# Altium schematic sheet ngoc.SchDoc
size A1
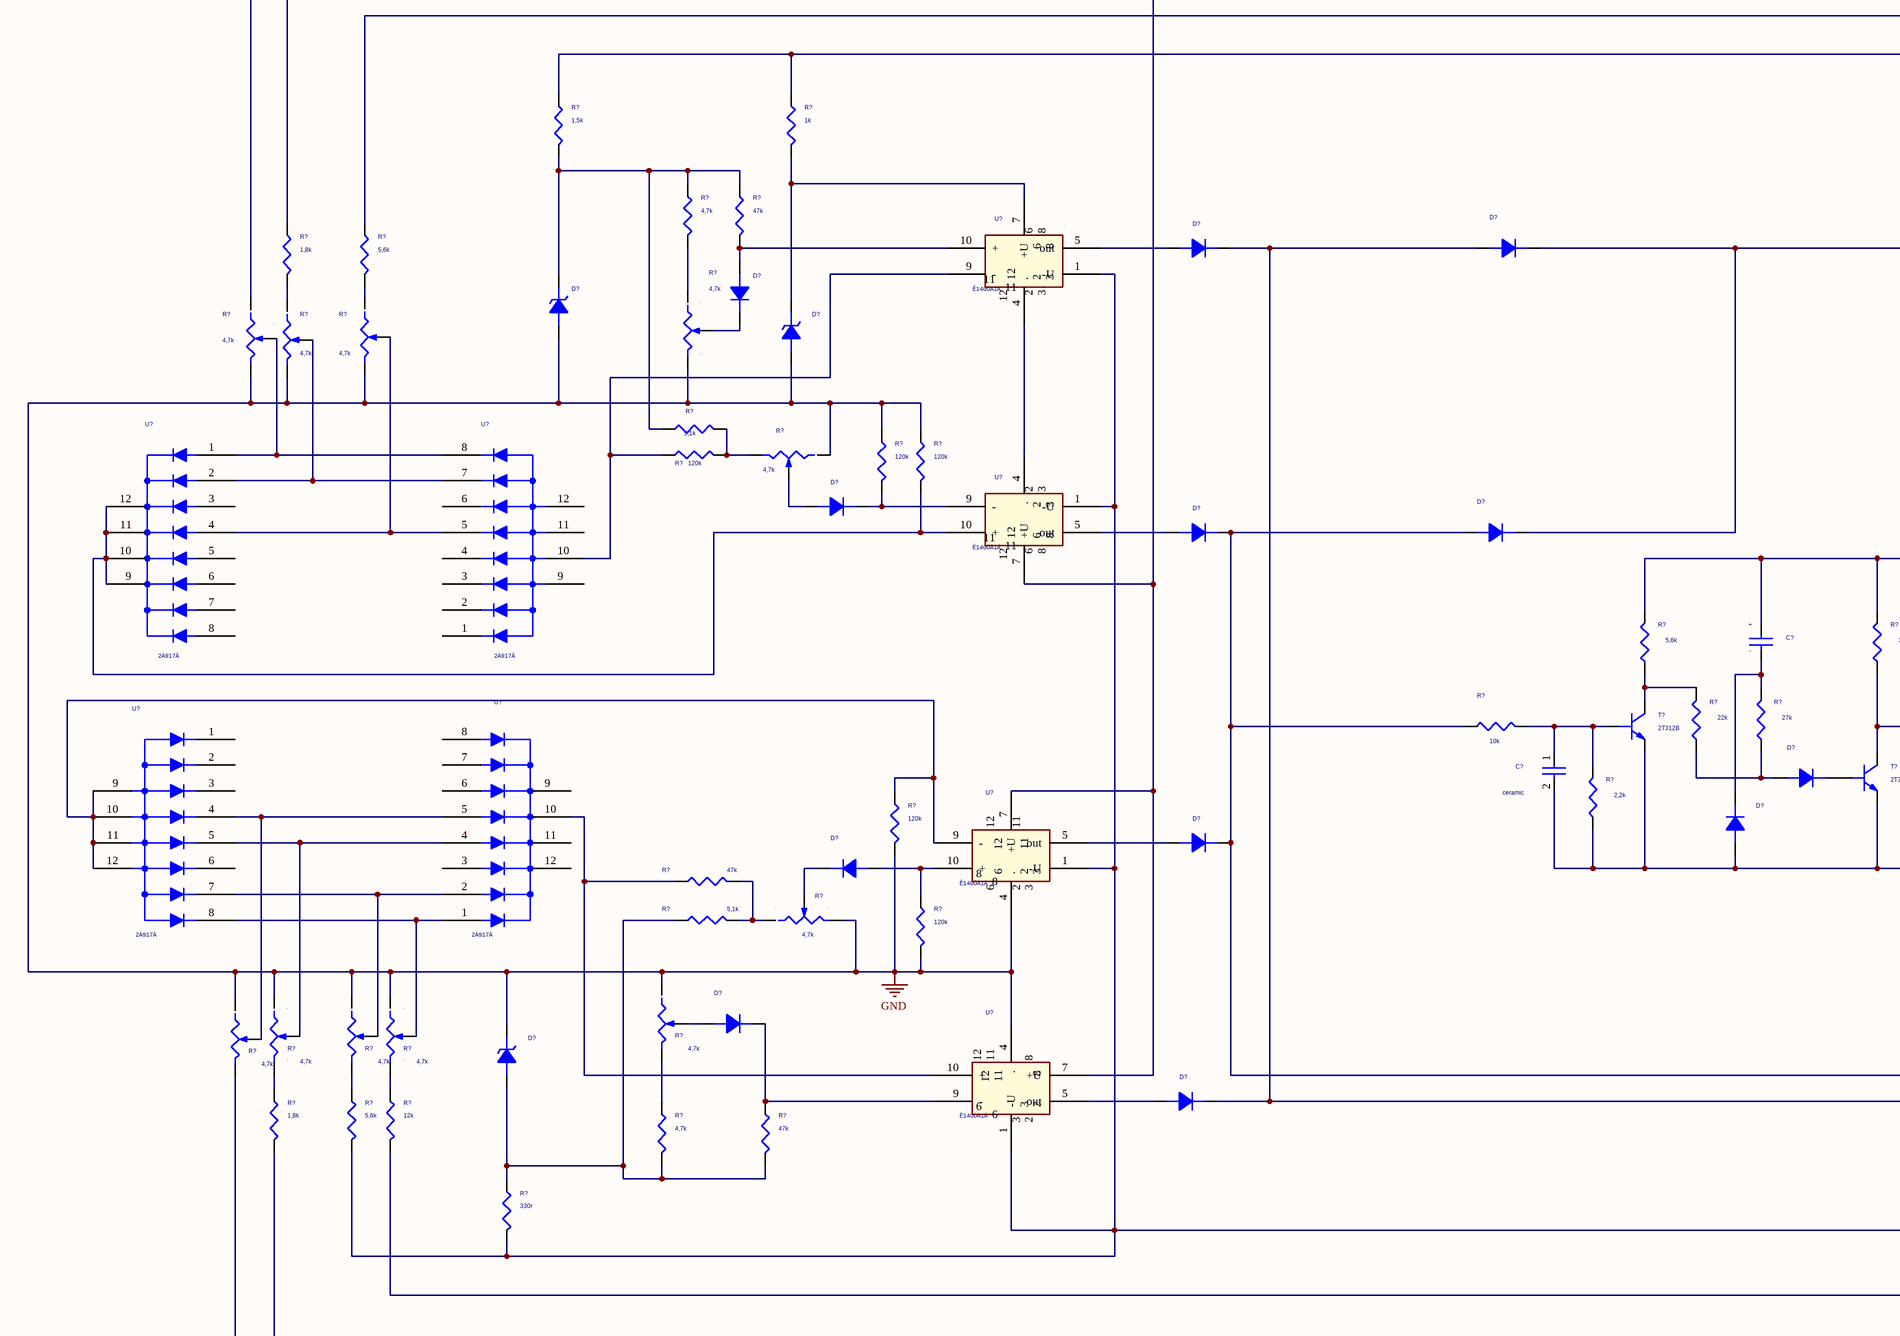
[diagram p0: ngoc.SchDoc, left]
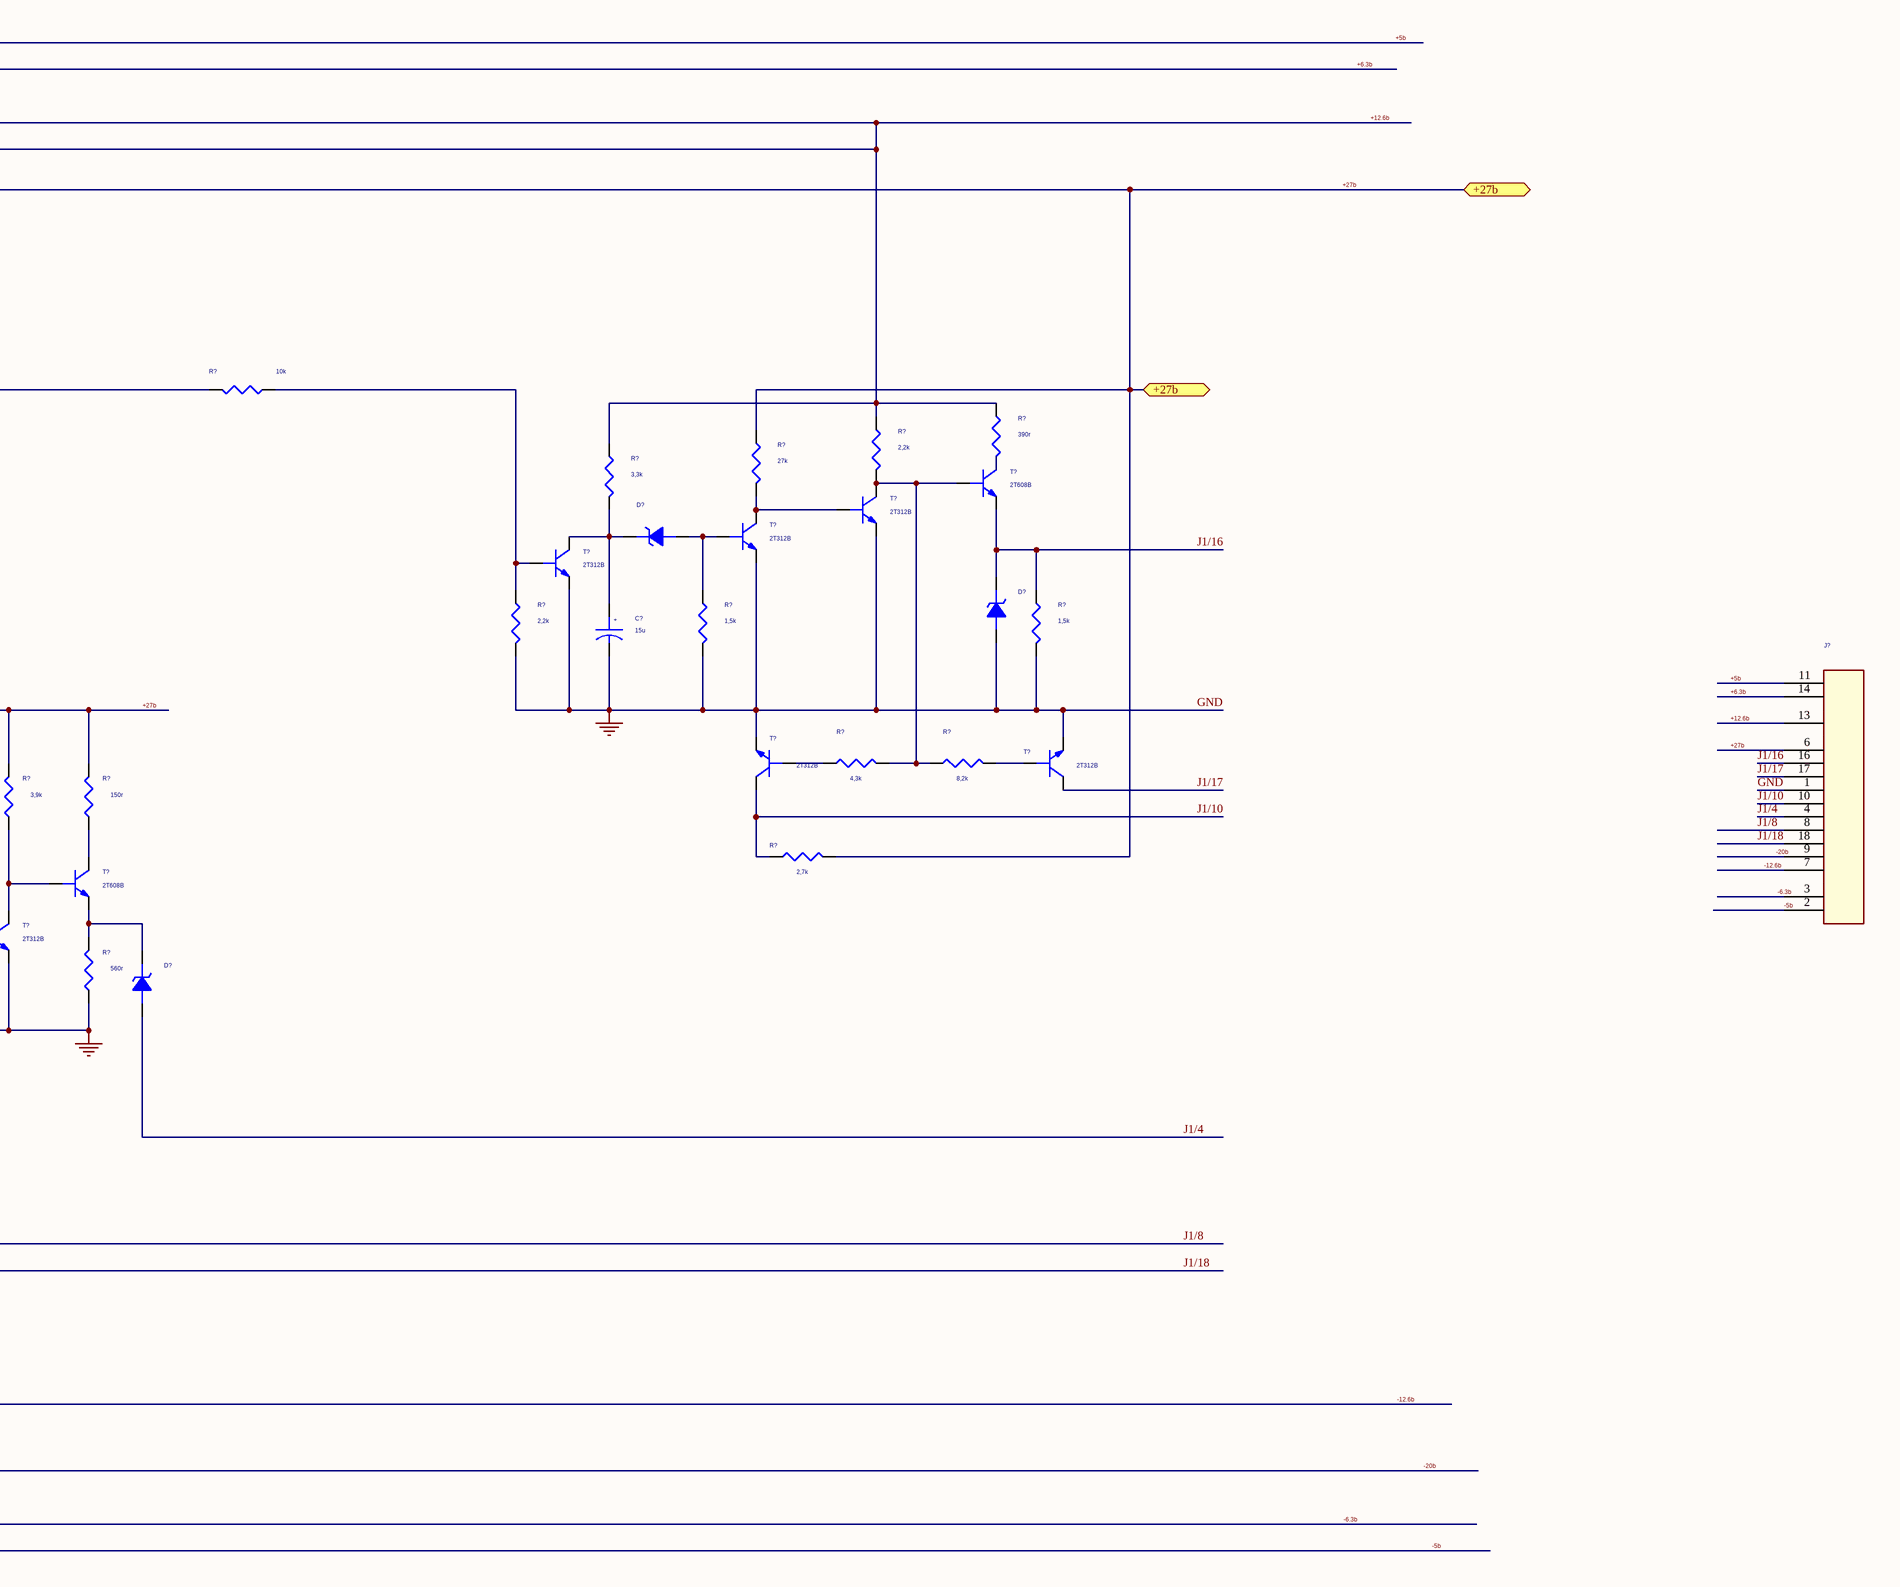
[diagram p1: ngoc.SchDoc, right]

## Parts
(Parts that share a designator on the sheet are numbered #1, #2 ... from top to bottom, then left to right.)
C?#1  15u  [capK53_1A]
C?#2  3,3u  [capK52_1]  (value not drawn)
C?#3  ceramic  [cap_km_5b]
D?#1  2D103A  [diode_2d103a]  (value not drawn)
D?#2  2D103A  [diode_2d103a]  (value not drawn)
D?#3  2D510A  [diode640_2d510]  (value not drawn)
D?#4  D818D  [diode_d818]  (value not drawn)
D?#5  DIODE ZENER  [diode_d818]  (value not drawn)
D?#6  D818D  [diode_d818]  (value not drawn)
D?#7  2456A  [diode_d818]  (value not drawn)
D?#8  2D510A  [diode640_2d510]  (value not drawn)
D?#9  2D103A  [diode_2d103a]  (value not drawn)
D?#10  2D103A  [diode_2d103a]  (value not drawn)
D?#11  2D103A  [diode_2d103a]  (value not drawn)
D?#12  2D103A  [diode_2d103a]  (value not drawn)
D?#13  2D510A  [diode640_2d510]  (value not drawn)
D?#14  2456A  [diode_d818]  (value not drawn)
D?#15  2D510A  [diode640_2d510]  (value not drawn)
D?#16  2D510A  [diode640_2d510]  (value not drawn)
D?#17  D818D  [diode_d818]  (value not drawn)
D?#18  2D103A  [diode_2d103a]  (value not drawn)
J?  con18  [con18]  (value not drawn)
R?#1  1,5k  [res_1w]
R?#2  1k  [res_1w]
R?#3  4,7k  [res0805]
R?#4  47k  [res0805]
R?#5  1,8k  [res0805]
R?#6  5,6k  [res0805]
R?#7  10k  [res0805]
R?#8  390r  [res_05w]
R?#9  2,2k  [res0805]
R?#10  4,7k  [res_var_cp5_3_3]
R?#11  27k  [res0805]
R?#12  4,7k  [res_var_cp5_3_4]
R?#13  4,7k  [res_var_cp5_3_4]
R?#14  4,7k  [res_var_cp5_3_3]
R?#15  3,3k  [res0805]
R?#16  5,1k  [res0805]
R?#17  120k  [res0805]
R?#18  120k  [res0805]
R?#19  2,2k  [res0805]
R?#20  1,5k  [res0805]
R?#21  1,5k  [res0805]
R?#22  120k  [res0805]
R?#23  4,7k  [res_var_cp5_3_4]
R?#24  4,3k  [res0805]
R?#25  8,2k  [res0805]
R?#26  5,6k  [res0805]
R?#27  3,9k  [res_05w]
R?#28  150r  [res0805]
R?#29  2,7k  [res_1w]
R?#30  10k  [res0805]
R?#31  22k  [res0805]
R?#32  27k  [res0805]
R?#33  120k  [res0805]
R?#34  2,2k  [res0805]
R?#35  560r  [res0805]
R?#36  47k  [res0805]
R?#37  4,7k  [res_var_cp5_3_3]
R?#38  120k  [res0805]
R?#39  5,1k  [res0805]
R?#40  4,7k  [res_var_cp5_3_4]
R?#41  4,7k  [res_var_cp5_3_4]
R?#42  4,7k  [res_var_cp5_3_3]
R?#43  4,7k  [res_var_cp5_3_4]
R?#44  4,7k  [res_var_cp5_3_3]
R?#45  1,8k  [res0805]
R?#46  5,6k  [res0805]
R?#47  12k  [res0805]
R?#48  4,7k  [res0805]
R?#49  47k  [res0805]
R?#50  330r  [res0805]
T?#1  2T608B  [to_2t608b_bce]
T?#2  2T312B  [to_2t312b_bec]
T?#3  2T312B  [to_2t312b_bec]
T?#4  2T312B  [to_2t312b_bec]
T?#5  2T312B  [to_2t312b_bec]
T?#6  2T312B  [to_2t312b_bec]
T?#7  2T312B  [to_2t312b_bec]
T?#8  2T608B  [to_2t608b_bce]
T?#9  2T312B  [to_2t312b_bec]
U?#1  to12_pin  [k140ud1_1]  (value not drawn)
U?#2  to12_pin  [k140ud1_1]  (value not drawn)
U?#3  2D908A  [2d908_917a]  (value not drawn)
U?#4  2D917A  [2d908_917a]  (value not drawn)
U?#5  2D917A  [2d908_917a]  (value not drawn)
U?#6  2D908A  [2d908_917a]  (value not drawn)
U?#7  to12_pin  [k140ud1_1]  (value not drawn)
U?#8  to12_pin  [k140ud1_1]  (value not drawn)

## Ports
+27b

## Nets
GND: C?#1.2 C?#3.2 D?#4.1(ANODE) D?#5.1(ANODE) D?#7.1(ANODE) D?#13.1(A) D?#17.2(CATHODE) J?.1 R?#10.3(B) R?#12.3(B) R?#13.3(B) R?#14.3(B) R?#17.1 R?#18.1 R?#19.2 R?#20.2 R?#21.2 R?#23.1(A) R?#33.2 R?#34.1 R?#35.1 R?#37.3(B) R?#38.2 R?#40.1(A) R?#41.1(A) R?#42.1(A) R?#43.1(A) R?#44.1(A) T?#2.2(E) T?#3.2(E) T?#4.2(E) T?#5.2(E) T?#6.2(E) T?#7.2(E) T?#9.2(E) U?#7.4(.) U?#8.4(.)
+5b: J?.11 R?#13.1(A)
+6.3b: J?.14 R?#5.1
+12.6b: J?.13 R?#6.1 R?#8.1 R?#9.1 R?#15.1 U?#2.7(+U) U?#7.7(+U) U?#8.7(+U)
+27b: C?#2.1 J?.6 R?#1.1 R?#2.1 R?#11.1 R?#26.2 R?#27.2 R?#28.2 R?#29.2 ; port +27b
-5b: J?.2 R?#41.3(B)
-6.3b: J?.3 R?#45.2
-12.6b: J?.7 R?#46.2 R?#50.2 U?#1.1(-U) U?#2.1(-U) U?#7.1(-U) U?#8.1(-U)
-20b: J?.9 R?#47.2
J1/4: D?#14.1(ANODE) J?.4
J1/8: D?#9.2(K) D?#10.1(A) D?#12.2(K) J?.8 R?#30.1
J1/10: J?.10 R?#29.1 T?#5.3(C)
J1/16: D?#7.2(CATHODE) J?.16 R?#21.1 T?#1.2(E)
J1/17: J?.17 T?#6.3(C)
J1/18: D?#1.2(K) D?#2.1(A) D?#18.2(K) J?.18
NetC?#1_1: C?#1.1 D?#6.2(CATHODE) R?#15.2 T?#4.3(C)
NetC?#2_2: C?#2.2 D?#13.2(K) R?#32.2
NetC?#3_1: C?#3.1 R?#30.2 R?#34.2 T?#7.1(B)
NetD?#1_1: D?#1.1(A) U?#1.5(out)
NetD?#2_2: D?#2.2(K) D?#10.2(K) R?#7.2
NetD?#3_1: D?#3.1(A) R?#4.2 U?#1.10(+)
NetD?#3_2: D?#3.2(K) R?#10.2(WIPER)
NetD?#4_2: D?#4.2(CATHODE) R?#1.2 R?#3.1 R?#4.1 R?#16.1
NetD?#5_2: D?#5.2(CATHODE) R?#2.2 U?#1.7(+U)
NetD?#6_1: D?#6.1(ANODE) R?#20.1 T?#3.1(B)
NetD?#8_1: D?#8.1(A) R?#23.2(WIPER)
NetD?#8_2: D?#8.2(K) R?#17.2 U?#2.9(-)
NetD?#9_1: D?#9.1(A) U?#2.5(out)
NetD?#11_1: D?#11.1(A) R?#31.1 R?#32.1
NetD?#11_2: D?#11.2(K) T?#9.1(B)
NetD?#12_1: D?#12.1(A) U?#7.5(out)
NetD?#14_2: D?#14.2(CATHODE) R?#35.2 T?#8.2(E)
NetD?#15_1: D?#15.1(A) R?#38.1 U?#7.10(+)
NetD?#15_2: D?#15.2(K) R?#37.2(WIPER)
NetD?#16_1: D?#16.1(A) R?#40.2(WIPER)
NetD?#16_2: D?#16.2(K) R?#49.1 U?#8.9(-)
NetD?#17_1: D?#17.1(ANODE) R?#39.1 R?#48.2 R?#49.2 R?#50.1
NetD?#18_1: D?#18.1(A) U?#8.5(out)
NetR?#3_2: R?#3.2 R?#10.1(A)
NetR?#5_2: R?#5.2 R?#14.1(A)
NetR?#6_2: R?#6.2 R?#12.1(A)
NetR?#7_1: R?#7.1 R?#19.1 T?#4.1(B)
NetR?#8_2: R?#8.2 T?#1.3(C)
NetR?#9_2: R?#9.2 R?#24.2 R?#25.1 T?#1.1(B) T?#2.3(C)
NetR?#11_2: R?#11.2 T?#2.1(B) T?#3.3(C)
NetR?#12_2: R?#12.2(WIPER) U?#3.4(E) U?#4.5(E)
NetR?#13_2: R?#13.2(WIPER) U?#3.1(DP2) U?#4.8(DP2)
NetR?#14_2: R?#14.2(WIPER) U?#3.2(G) U?#4.7(G)
NetR?#16_2: R?#16.2 R?#22.2 R?#23.3(B)
NetR?#18_2: R?#18.2 U?#2.10(+) U?#3.9(CA1) U?#3.10(CA2) U?#3.11(CA3) U?#3.12(CA4)
NetR?#22_1: R?#22.1 U?#1.9(-) U?#4.10(CA2)
NetR?#24_1: R?#24.1 T?#5.1(B)
NetR?#25_2: R?#25.2 T?#6.1(B)
NetR?#26_1: R?#26.1 R?#31.2 T?#7.3(C)
NetR?#27_1: R?#27.1 T?#8.1(B) T?#9.3(C)
NetR?#28_1: R?#28.1 T?#8.3(C)
NetR?#33_1: R?#33.1 U?#5.9(CA1) U?#5.10(CA2) U?#5.11(CA3) U?#5.12(CA4) U?#7.9(-)
NetR?#36_1: R?#36.1 U?#6.10(CA2) U?#8.10(+)
NetR?#36_2: R?#36.2 R?#37.1(A) R?#39.2
NetR?#40_3: R?#40.3(B) R?#48.1
NetR?#41_2: R?#41.2(WIPER) U?#5.4(D) U?#6.5(D)
NetR?#42_2: R?#42.2(WIPER) U?#5.5(E) U?#6.4(E)
NetR?#42_3: R?#42.3(B) R?#45.1
NetR?#43_2: R?#43.2(WIPER) U?#5.7(G) U?#6.2(G)
NetR?#43_3: R?#43.3(B) R?#46.1
NetR?#44_2: R?#44.2(WIPER) U?#5.8(DP2) U?#6.1(DP2)
NetR?#44_3: R?#44.3(B) R?#47.1
NetU?#1_4: U?#1.4(.) U?#2.4(.)

Not connected (* = marked no-connect by the designer): J? 5 12 15; R?#10 4 5; R?#14 4 5; R?#37 4 5; R?#42 4 5; R?#44 4 5; U?#1 2 3 6 8 11 12; U?#2 2 3 6 8 11 12; U?#3 3(F) 5(D) 6(C) 7(B) 8(A); U?#4 1(A) 2(B) 3(C) 4(D) 6(F) 9(CA1) 11(CA3) 12(CA4); U?#5 1(A) 2(B) 3(C) 6(F); U?#6 3(F) 6(C) 7(B) 8(A) 9(CA1) 11(CA3) 12(CA4); U?#7 2 3 6 8 11 12; U?#8 2 3 6 8 11 12

## Notes on the sheet
- (near C?#2) +
- (near C?#2) -
- (in symbol CAP POL) +
- (in symbol K140UD1B_8) Ê140ÓÄ1Á
- (in symbol K140UD1B_9) Ê140ÓÄ1Á
- (in symbol K140UD1B_10) Ê140ÓÄ1Á
- (in symbol K140UD1B_13) Ê140ÓÄ1Á
- (in symbol LDS-A81R_20) 2Ä917À
- (in symbol LDS-A81R_21) 2Ä917À
- (in symbol LDS-A81R_22) 2Ä917À
- (in symbol LDS-A81R_25) 2Ä917À

## Library data of the parts
C?#1 = CAP POL
C?#2 = CAP NP_Dup1
C?#3 = CAP NP
D?#1-D?#3 D?#8-D?#13 D?#15 D?#16 D?#18 = DIODE
D?#4 D?#6 D?#7 D?#14 D?#17 = DIODE ZENER
J? = CON18_1
R?#1-R?#9 R?#11 R?#15-R?#22 R?#24-R?#36 R?#38 R?#39 R?#45-R?#50 = RESISTOR_0
R?#10 R?#37 R?#42 R?#44 = RESISTOR VAR_1
R?#12 = RESISTOR VAR_5
R?#13 = RESISTOR VAR_3
R?#14 = RESISTOR VAR_4
R?#23 = RESISTOR VAR_6
R?#40 = RESISTOR VAR_8
R?#41 = RESISTOR VAR_10
R?#43 = RESISTOR VAR_7
T?#1-T?#9 = NPN ECB_0
U?#1 = K140UD1B_10
U?#2 = K140UD1B_9
U?#3 = LDS-A81R_20
U?#4 = LDS-A81R_25
U?#5 = LDS-A81R_22
U?#6 = LDS-A81R_21
U?#7 = K140UD1B_8
U?#8 = K140UD1B_13